# Altium schematic sheet 1700-0003_PowerBoard_REV-A_0.SchDoc: 1700-0003_PowerBoard_REV-A
size 897 x 577 mm; DRAWING_DATE: 4/15/2022; DRAWING_TITLE: PQI380 UNIV. INTERFACE BRD; PART_NUMBER: 7000-0303; REV: R12; Origin: Eagle; DWG-CO-NAME: DWG-CO-NAME; DWG-DATE: DWG-DATE; DWG-NUMBER: DWG-NUMBER; DWG-REV: DWG-REV; DWG-TITLE: DWG-TITLE; SIZE: SIZE; Date: 7/10/2024 1:57:37 PM; SheetNumber: 1; GateName_1: G$1; SymbolName_1: FRAME_D_L; LibraryName: frames; DeviceSetName: FRAME_D_L; GateName_2: G$2; SymbolName_2: DOCFIELD; Sheet: Sheet:
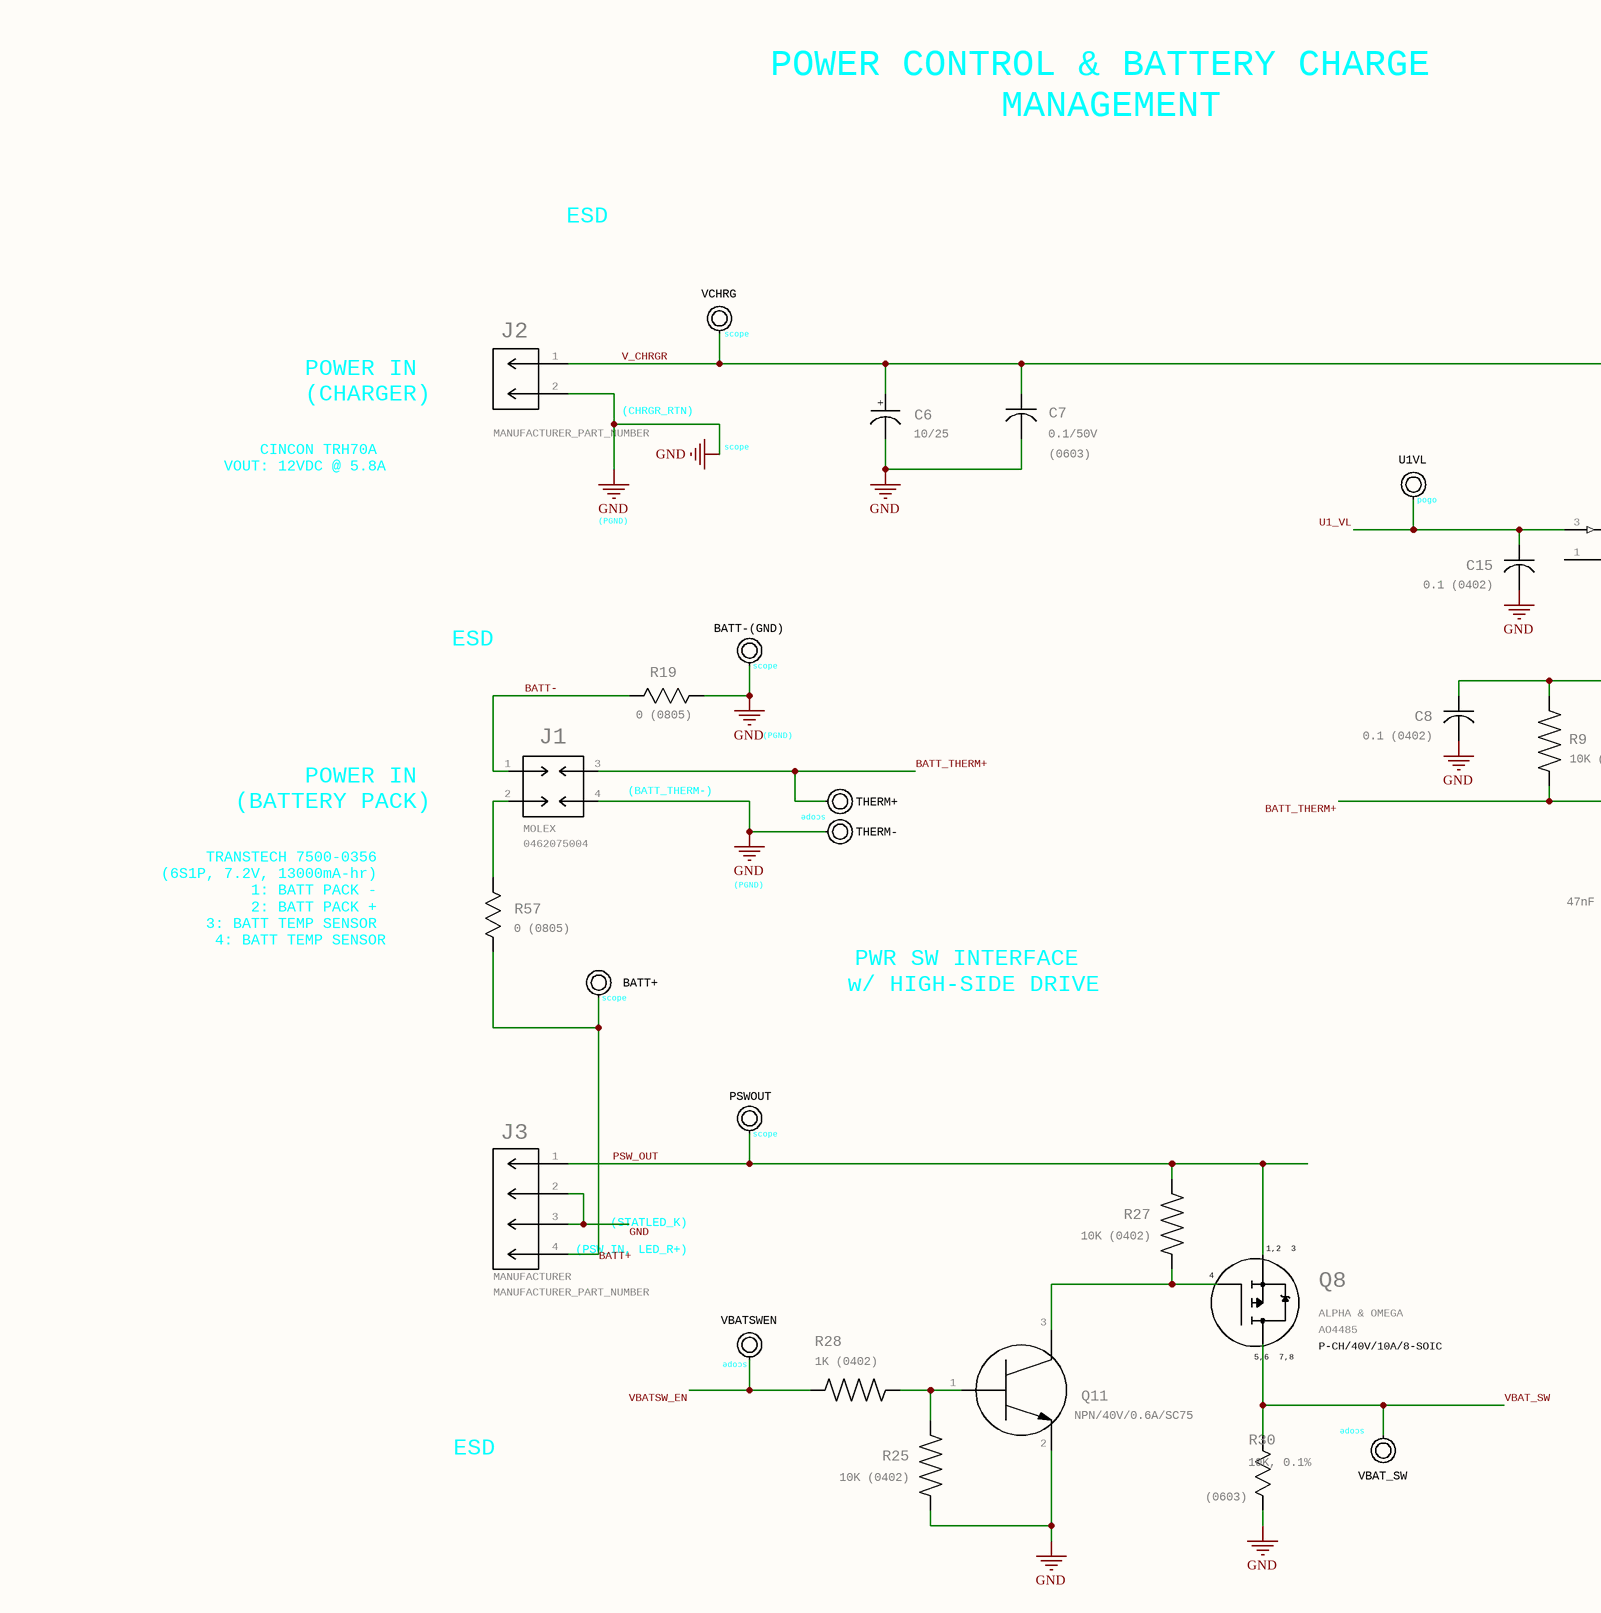
[diagram p0: 1700-0003_PowerBoard_REV-A_0.SchDoc, top left]
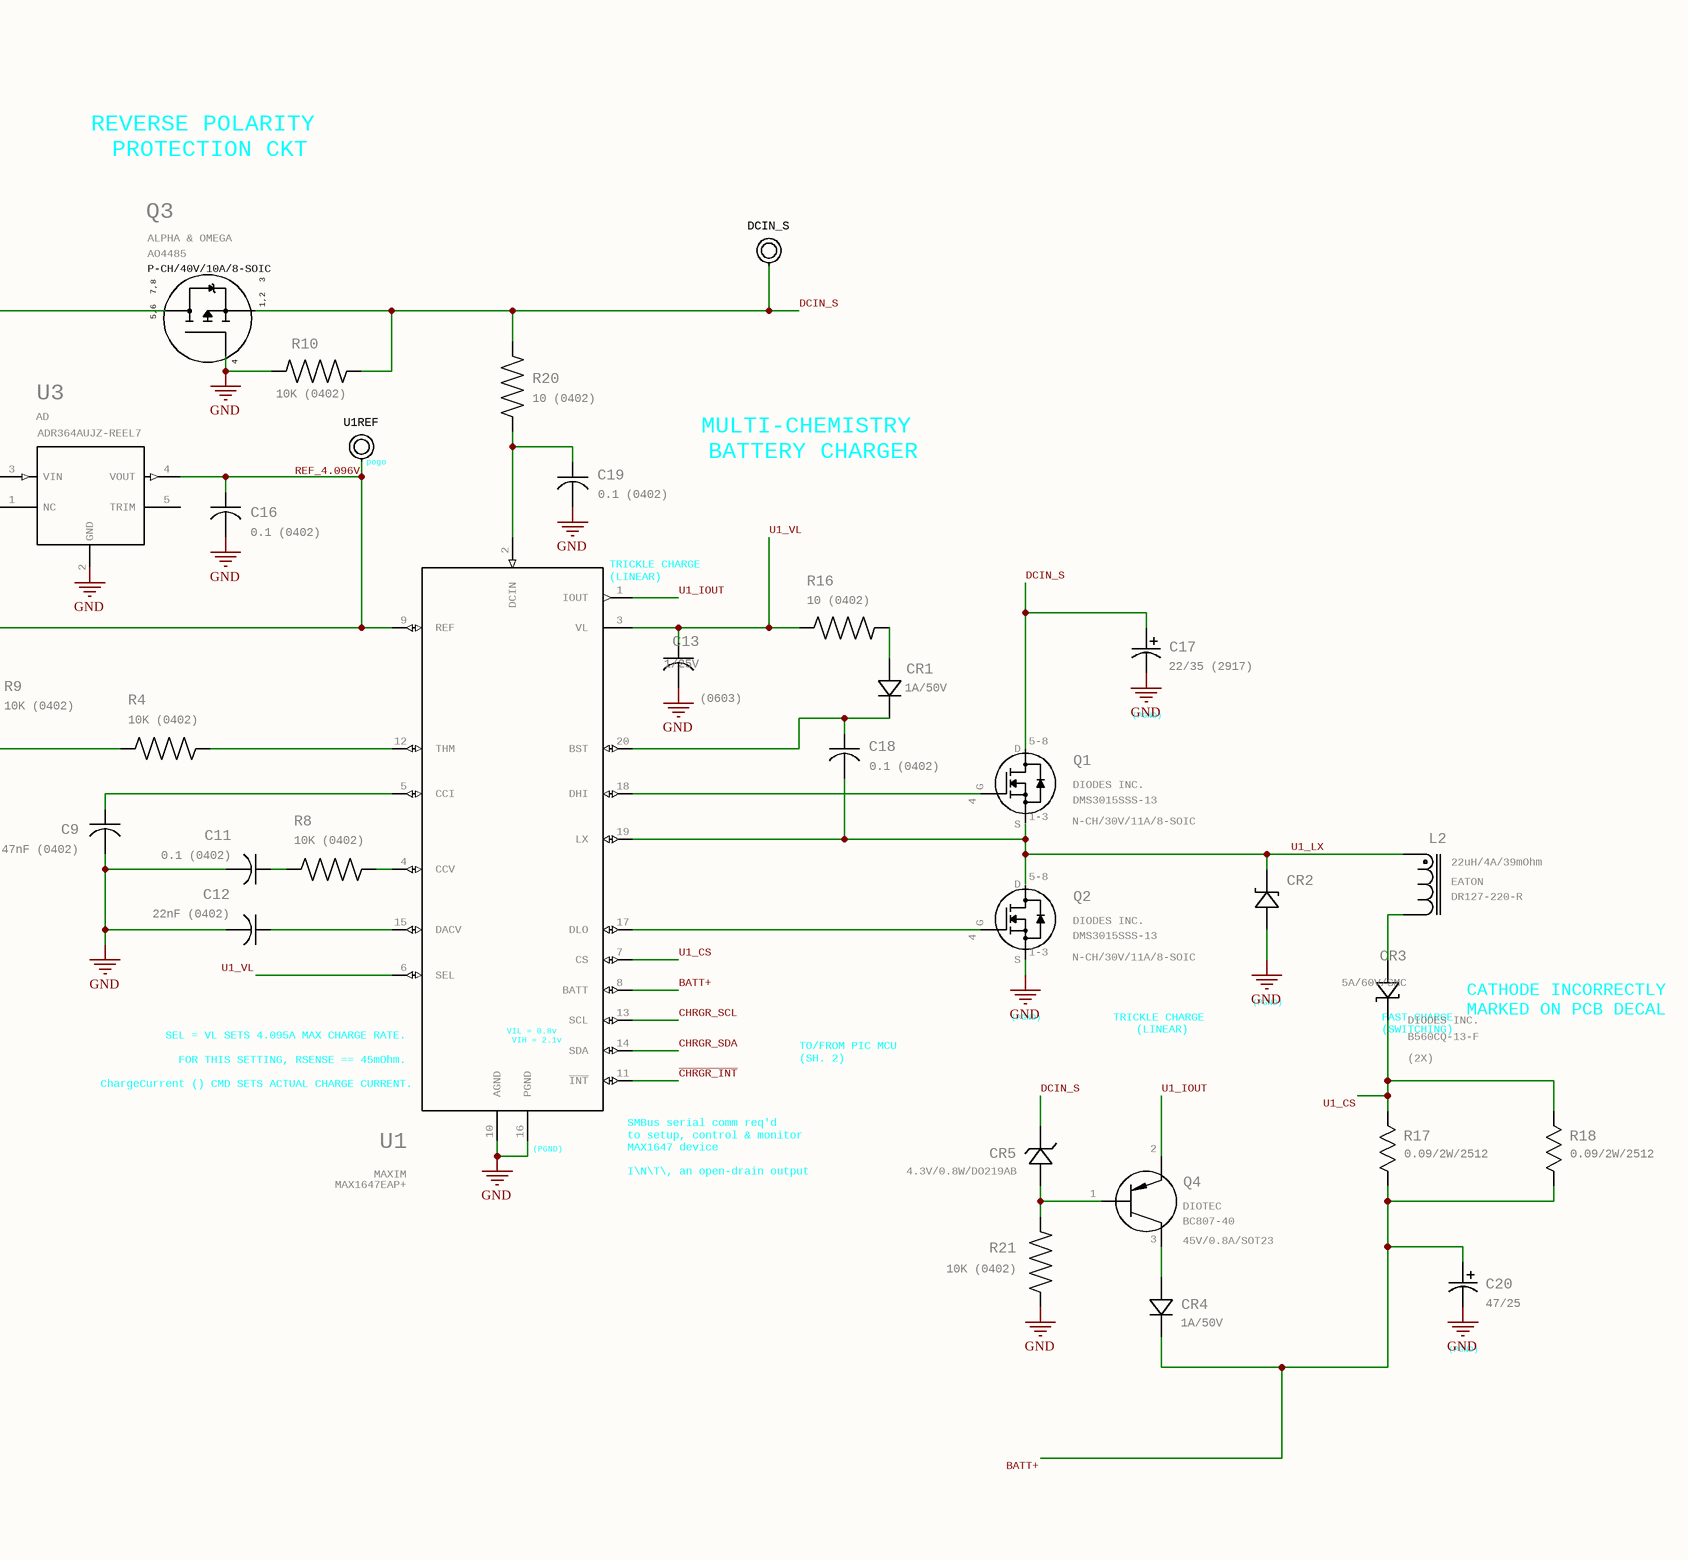
[diagram p1: 1700-0003_PowerBoard_REV-A_0.SchDoc, top middle]
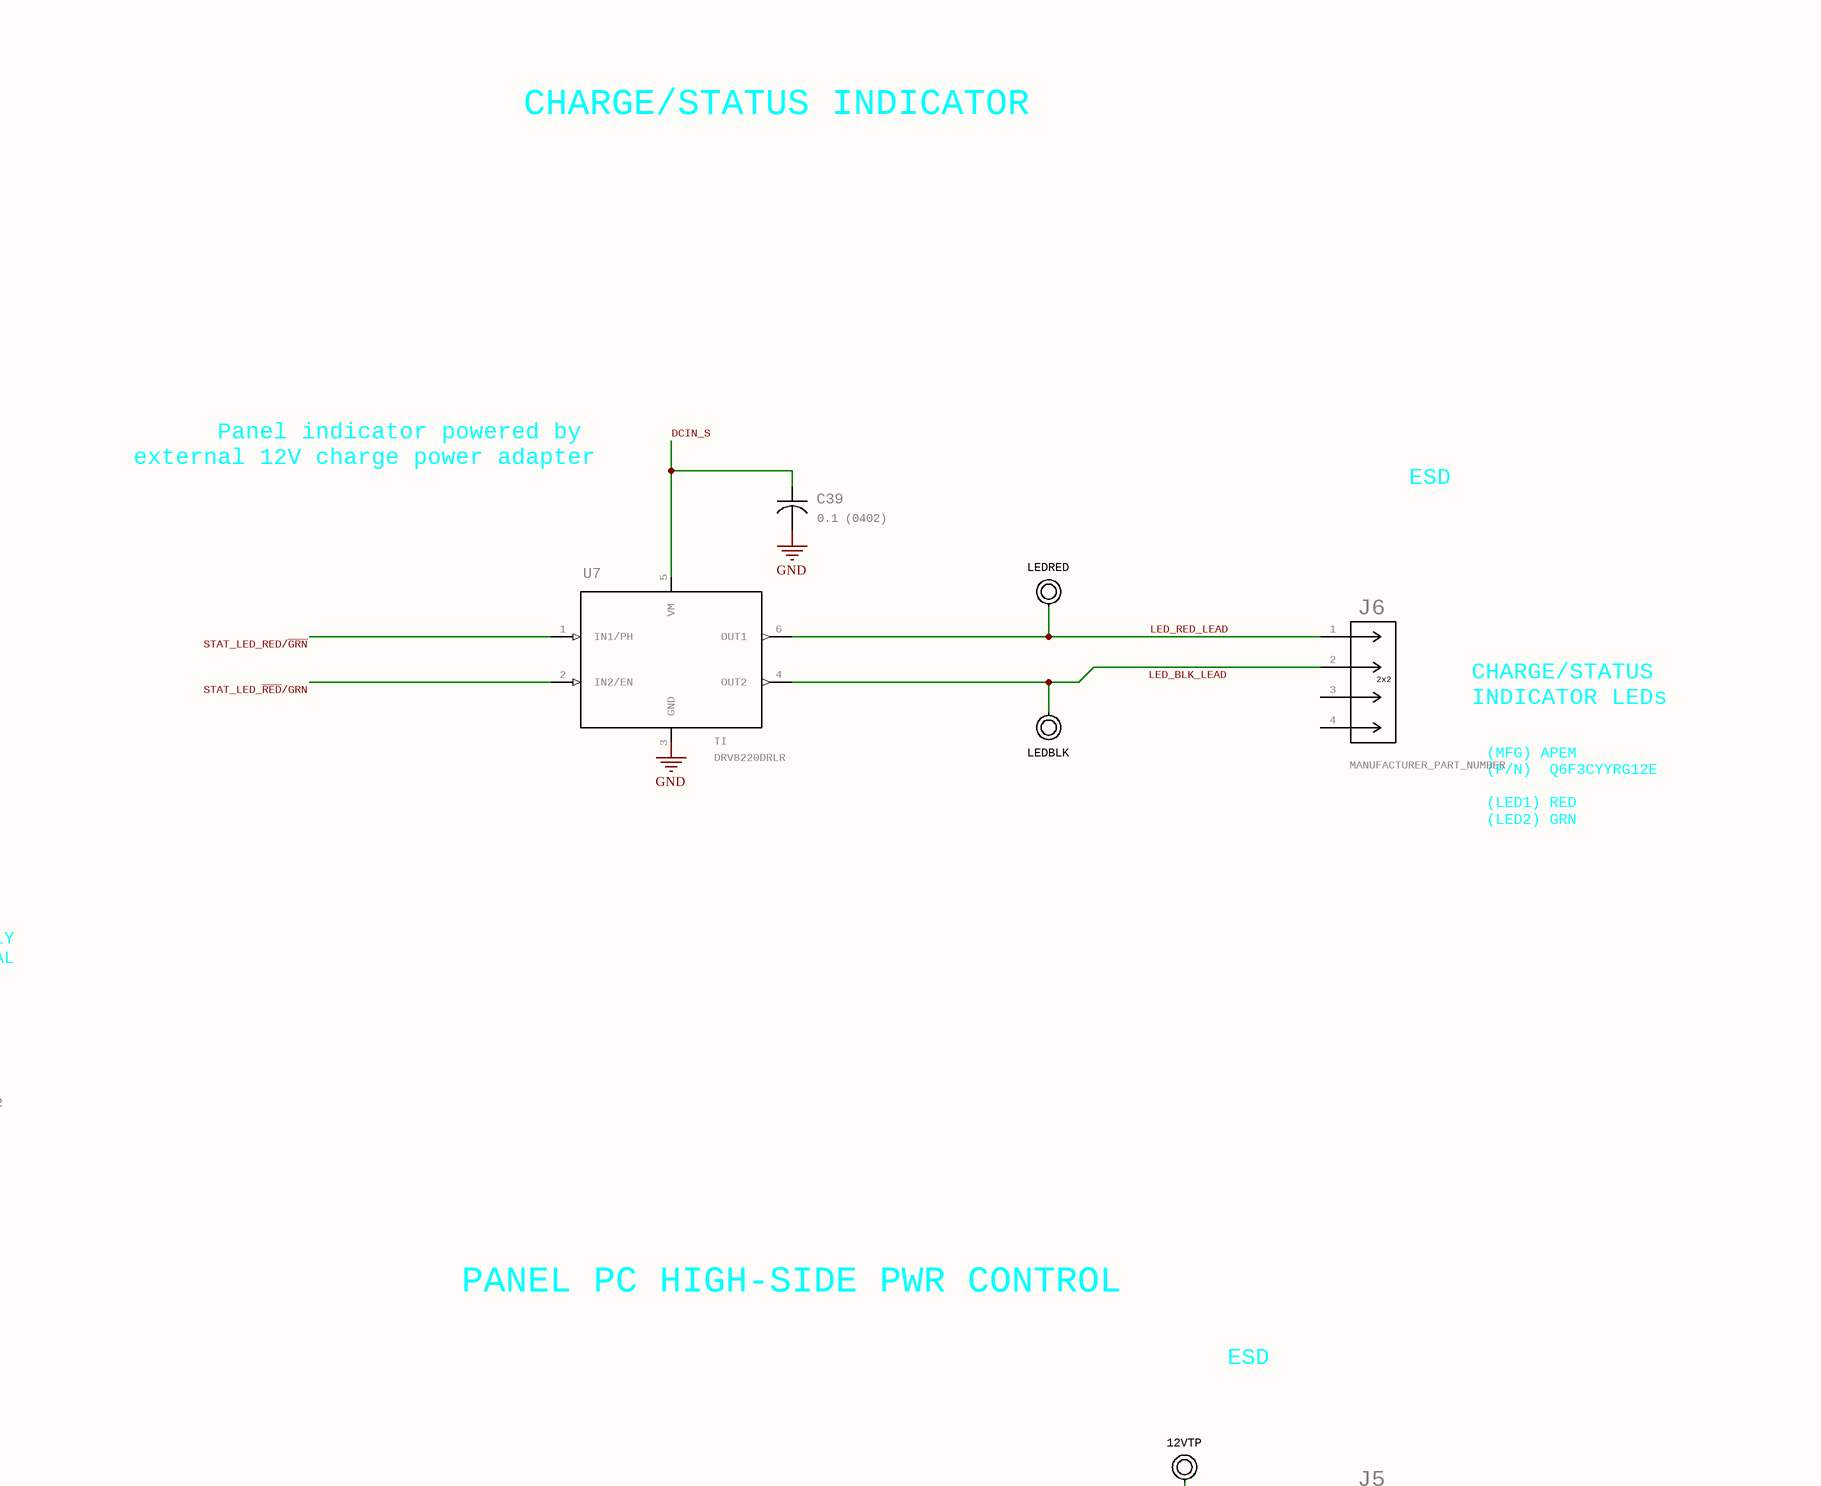
[diagram p2: 1700-0003_PowerBoard_REV-A_0.SchDoc, top right]
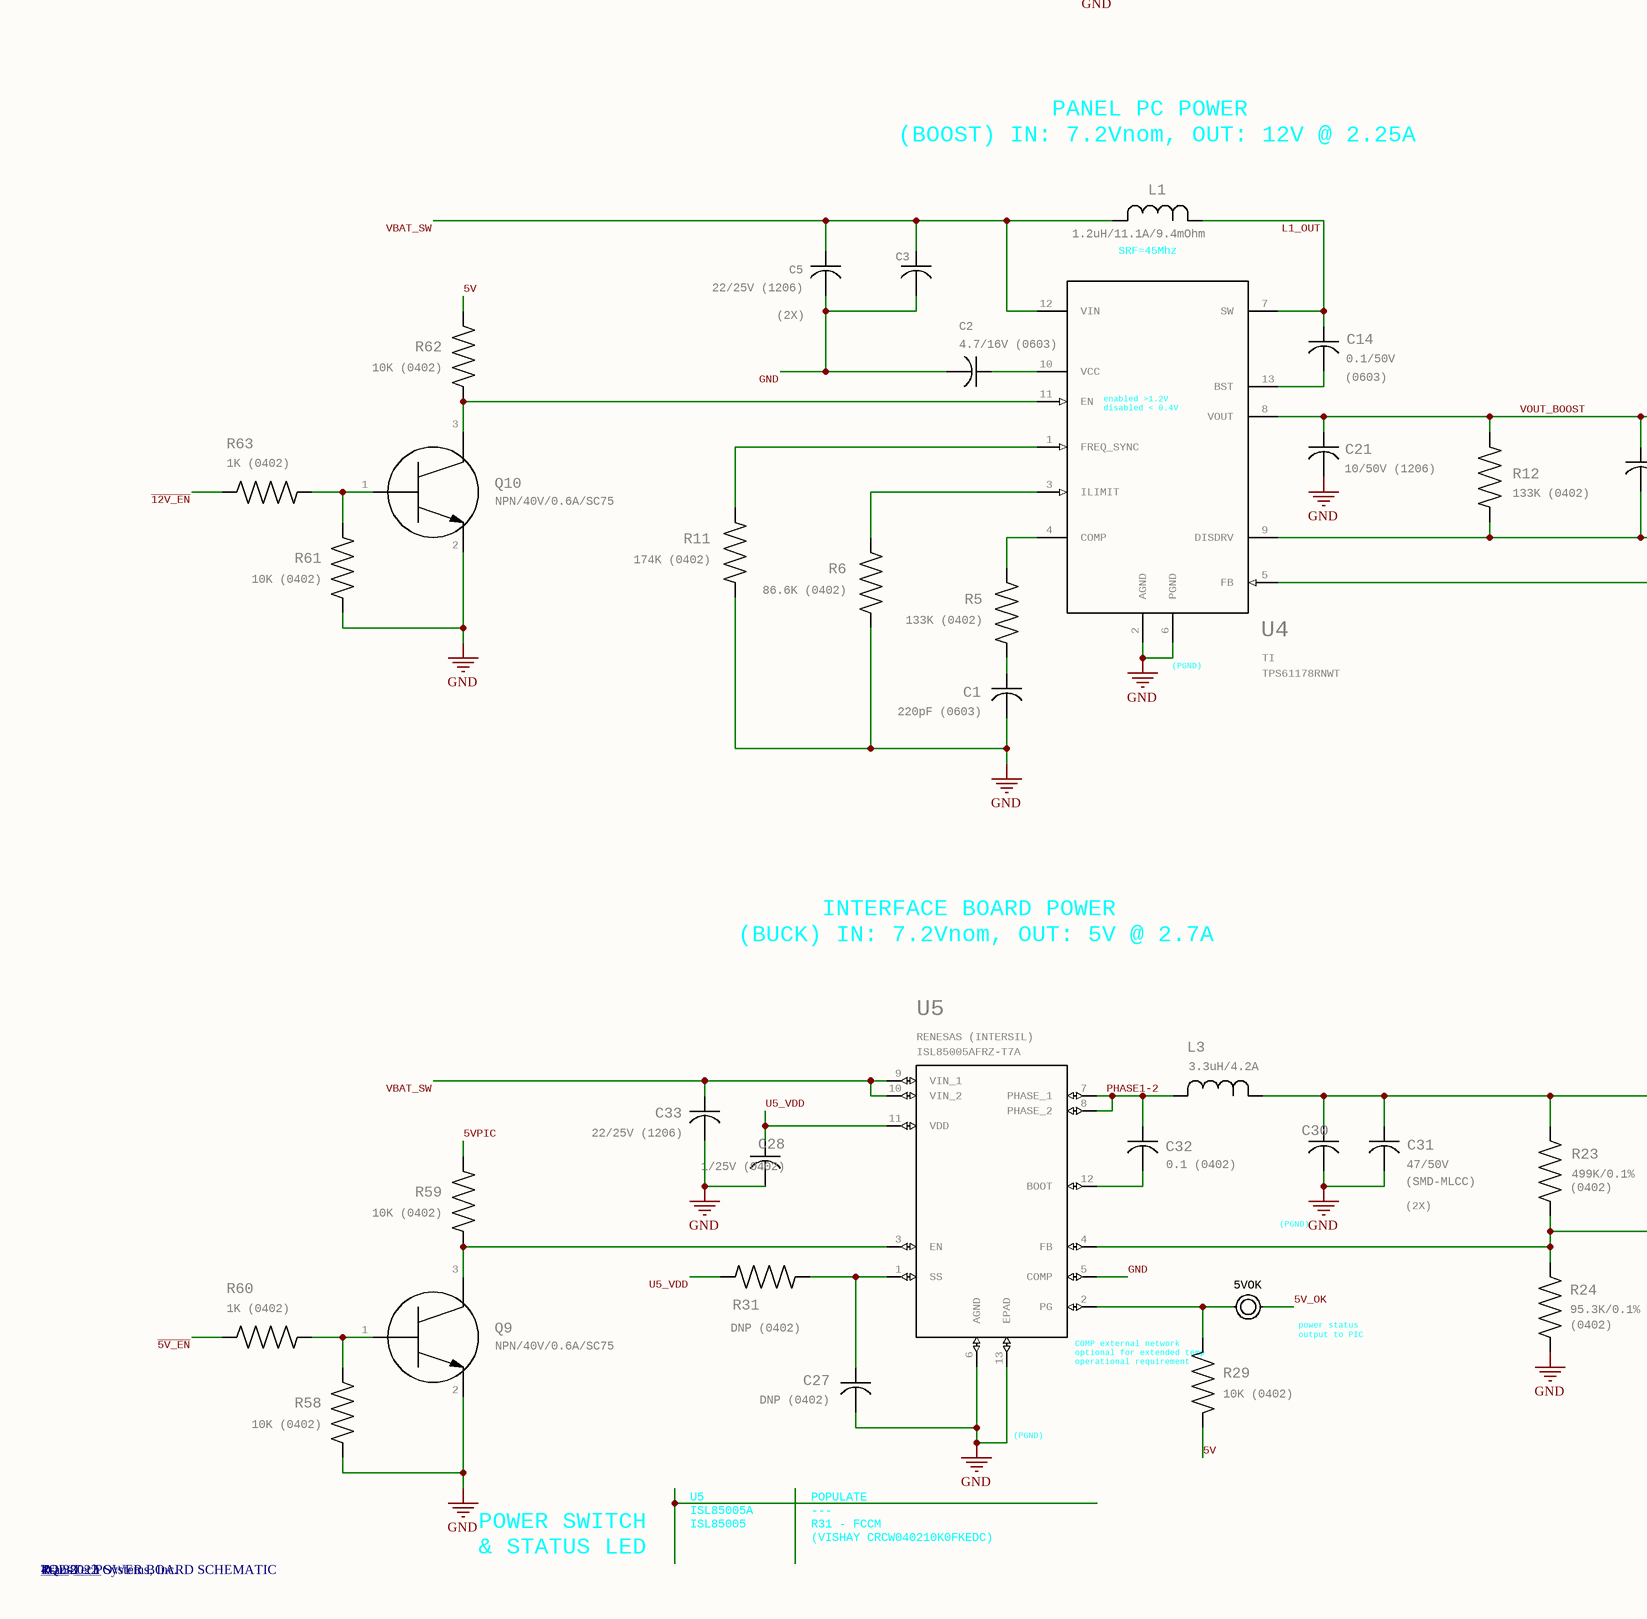
[diagram p3: 1700-0003_PowerBoard_REV-A_0.SchDoc, bottom left]
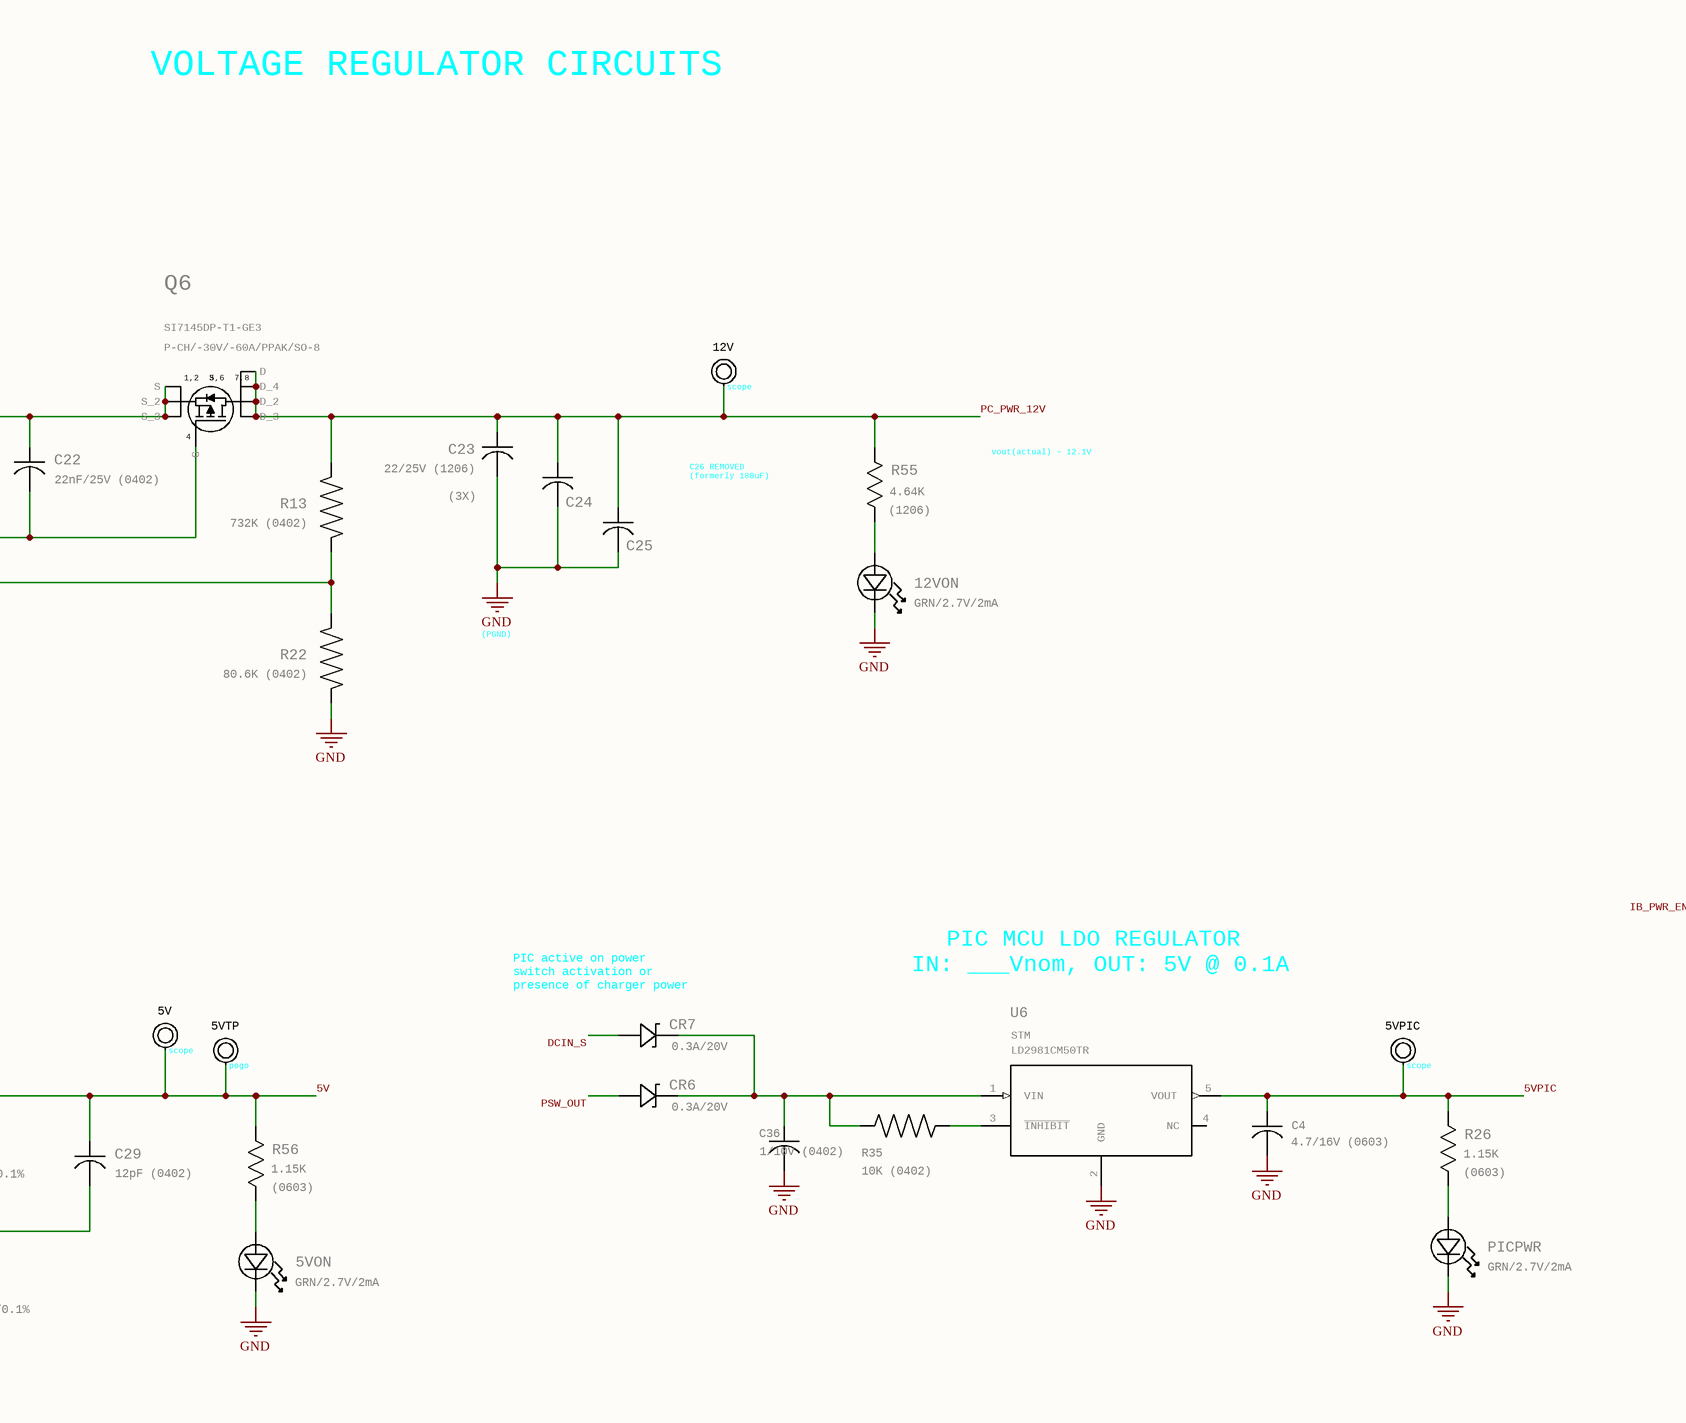
[diagram p4: 1700-0003_PowerBoard_REV-A_0.SchDoc, bottom middle]
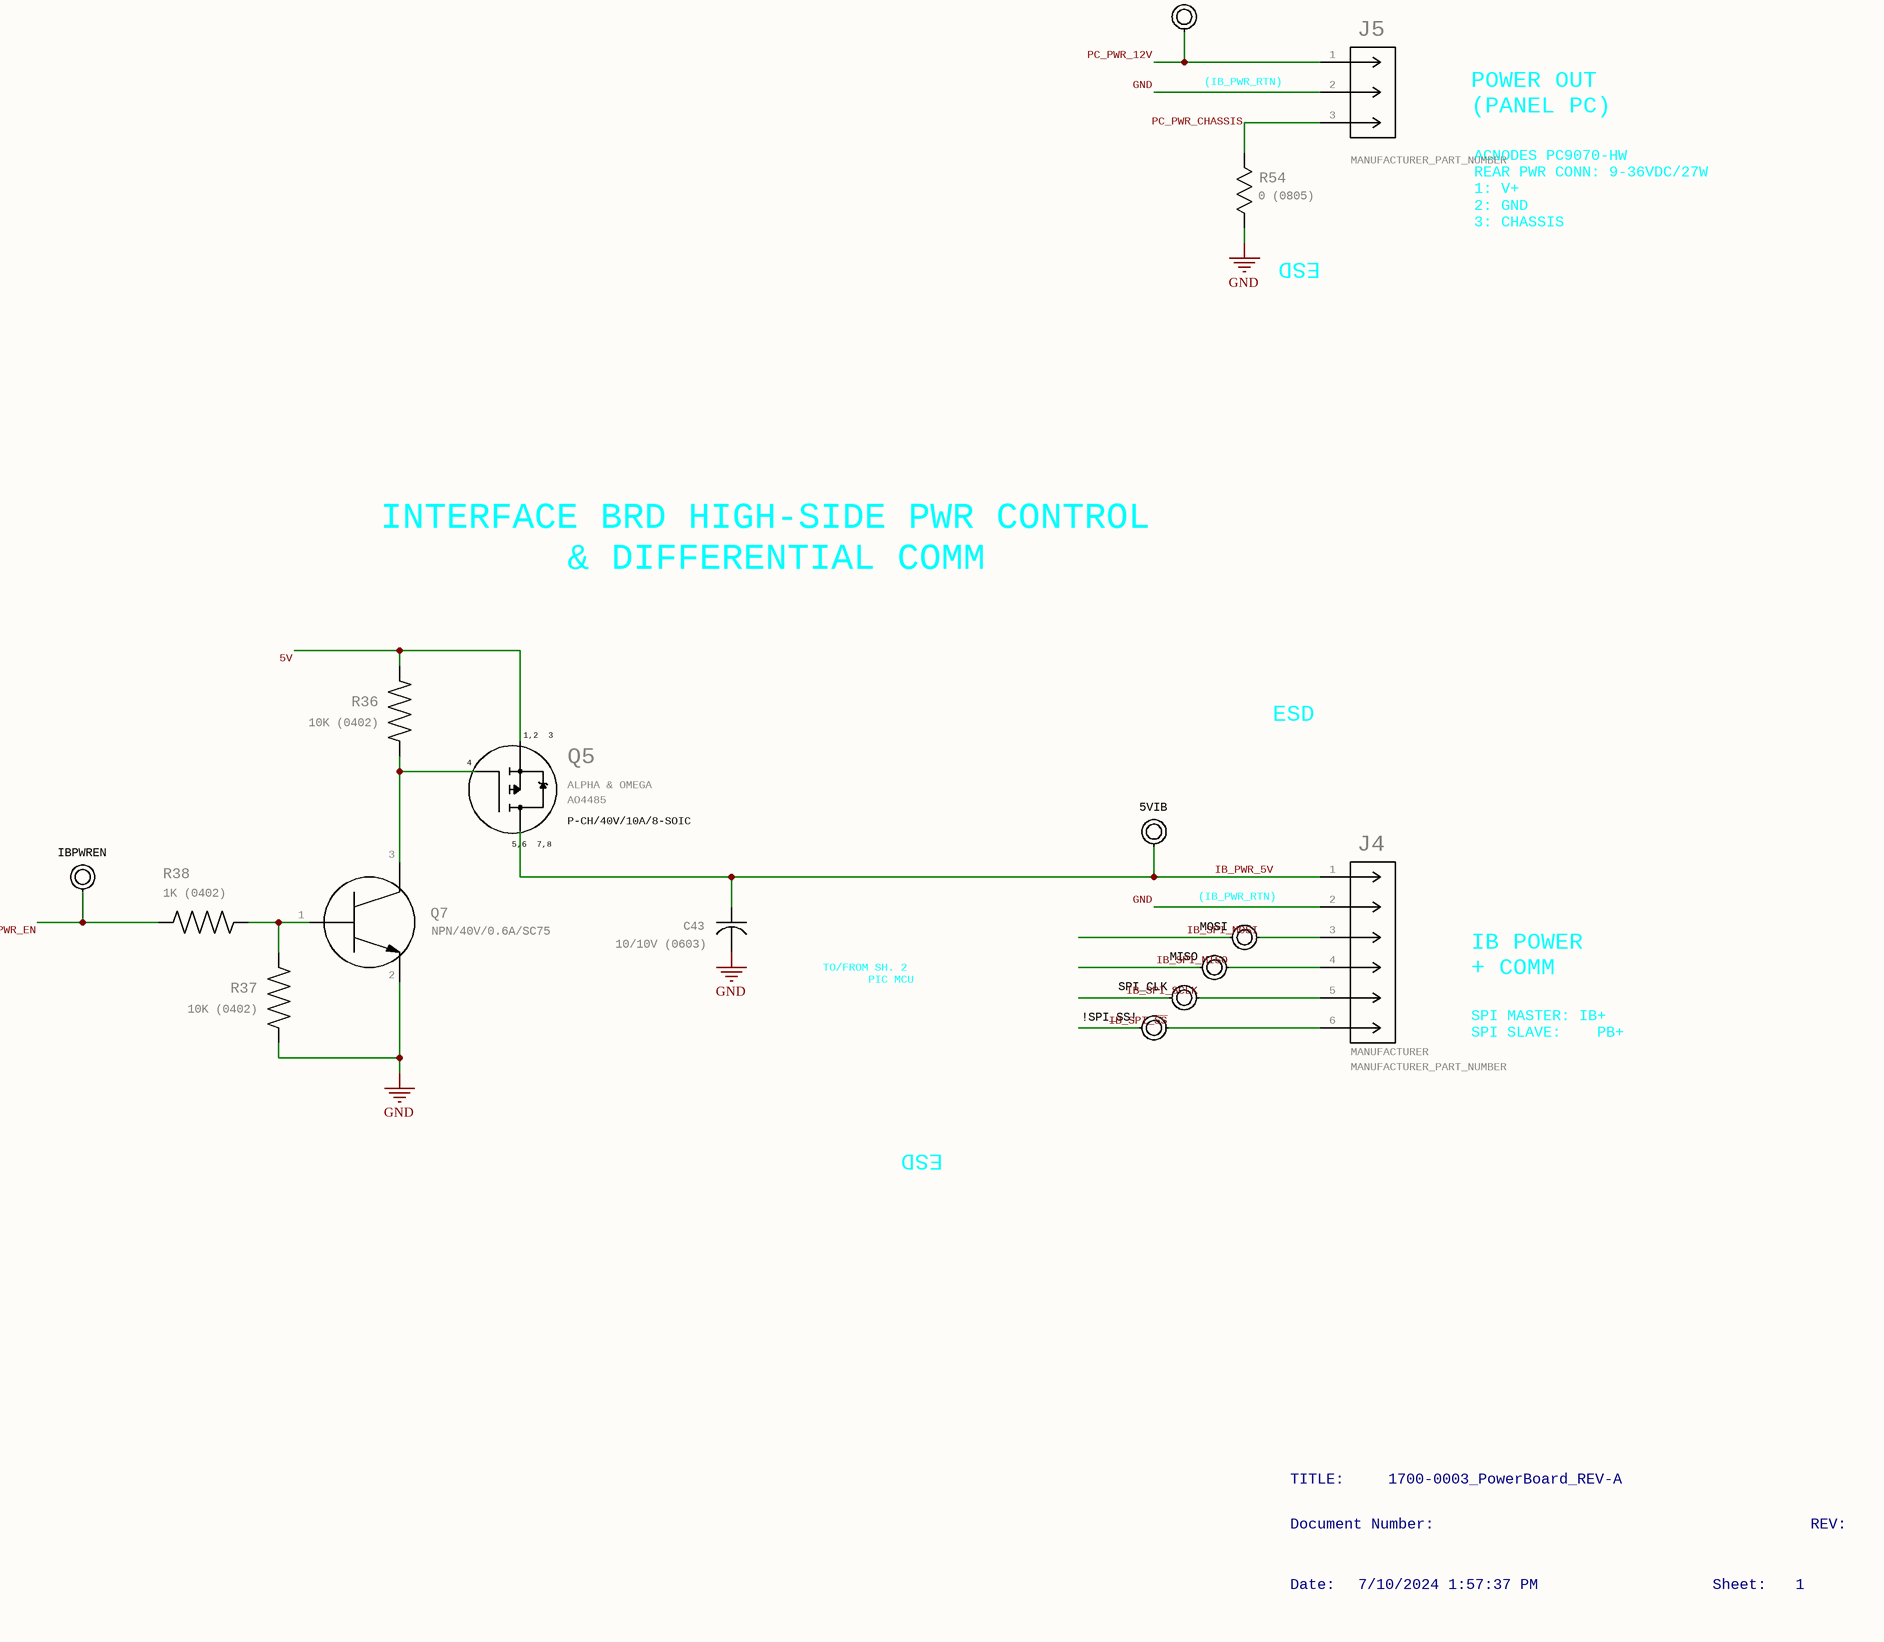
[diagram p5: 1700-0003_PowerBoard_REV-A_0.SchDoc, bottom right]

## Parts
5V  TST_POINT_PTH_042-OCT  [TST_POINT_PTH_042-OCT]  (value not drawn)
5VIB  TST_POINT_PTH_20X40MIL  [TST_POINT_PTH_20X40MIL]  (value not drawn)
5VOK  TST_POINT_PTH_20X40MIL_2PIN  [TST_POINT_PTH_20X40MIL_2PIN]  (value not drawn)
5VON  GRN/2.7V/2mA  [LED_DIALIGHT_598_DIA]
5VPIC  TST_POINT_PTH_042-OCT  [TST_POINT_PTH_042-OCT]  (value not drawn)
5VTP  TST_POINT_PTH_20X40MIL  [TST_POINT_PTH_20X40MIL]  (value not drawn)
12V  TST_POINT_PTH_042-OCT  [TST_POINT_PTH_042-OCT]  (value not drawn)
12VON  GRN/2.7V/2mA  [LED_DIALIGHT_598_DIA]
12VTP  TST_POINT_PTH_20X40MIL  [TST_POINT_PTH_20X40MIL]  (value not drawn)
!SPI_SS!  TST_POINT_PTH_042_2PIN  [TST_POINT_PTH_042-OCT_2PIN]  (value not drawn)
BATT+  TST_POINT_PTH_042-OCT  [TST_POINT_PTH_042-OCT]  (value not drawn)
BATT-(GND)  TST_POINT_PTH_042-OCT  [TST_POINT_PTH_042-OCT]  (value not drawn)
C1  220pF (0603)  [CAP_C1608_TDK]
C2  4.7/16V (0603)  [CAP_C1608_TDK]
C3  22/25V (1206)  [CAP_CL31_SAM]  (value not drawn)
C4  4.7/16V (0603)  [CAP_C1608_TDK]
C5  22/25V (1206)  QTY_AREA: (2X)  [CAP_CL31_SAM]
C6  10/25  [CAP_AFK106M25B12T-F_CND-L]
C7  0.1/50V  PACKAGE: (0603)  [CAP_C1608_TDK]
C8  0.1 (0402)  [G-155_MUR]
C9  47nF (0402)  [G-155_MUR]
C11  0.1 (0402)  [G-155_MUR]
C12  22nF (0402)  [G-155_MUR]
C13  1/25V  PACKAGE: (0603)  [CAP_C1608_TDK]
C14  0.1/50V  PACKAGE: (0603)  [CAP_C1608_TDK]
C15  0.1 (0402)  [G-155_MUR]
C16  0.1 (0402)  [G-155_MUR]
C17  22/35 (2917)  [CAPMP7.6X4.3_3.1N_KEM]
C18  0.1 (0402)  [G-155_MUR]
C19  0.1 (0402)  [G-155_MUR]
C20  47/25  [CAPMP7.6X4.3_3.1N_KEM]
C21  10/50V (1206)  [CAP_CL31_SAM]
C22  22nF/25V (0402)  [G-155_MUR]
C23  22/25V (1206)  QTY_AREA: (3X)  [CAP_CL31_SAM]
C24  22/25V (1206)  [CAP_CL31_SAM]  (value not drawn)
C25  22/25V (1206)  [CAP_CL31_SAM]  (value not drawn)
C27  DNP (0402)  [G-155_MUR]
C28  1/25V (0402)  [G-155_MUR]
C29  12pF (0402)  [G-155_MUR]
C30  47/50V (MLCC-SMD)  [CAP_CKG57N_TDK]  (value not drawn)
C31  47/50V  PACKAGE: (SMD-MLCC)  QTY_AREA: (2X)  [CAP_CKG57N_TDK]
C32  0.1 (0402)  [G-155_MUR]
C33  22/25V (1206)  [CAP_CL31_SAM]
C36  1/10V (0402)  [G-155_MUR]
C39  0.1 (0402)  [G-155_MUR]
C43  10/10V (0603)  [CAP_C1608_TDK]
CR1  1A/50V  [SMA_DIO]
CR2  5A/60V/SMC  [CR_0CQ-13-F_DIO]  (value not drawn)
CR3  5A/60V/SMC  MANUFACTURER: DIODES INC.  MANUFACTURER_PART_NUMBER: B560CQ-13-F  QTY_AREA: (2X)  [CR_0CQ-13-F_DIO]
CR4  1A/50V  [SMA_DIO]
CR5  4.3V/0.8W/DO219AB  [DIO_BZD27C4V3P_VIS]
CR6  0.3A/20V  [USC_TOS]
CR7  0.3A/20V  [USC_TOS]
DCIN_S  TST_POINT_PTH_042-OCT  [TST_POINT_PTH_042-OCT]  (value not drawn)
IBPWREN  TST_POINT_PTH_042-OCT  [TST_POINT_PTH_042-OCT]  (value not drawn)
J1  MANUFACTURER: MOLEX  MANUFACTURER_PART_NUMBER: 0462075004  [MOLEX_462075004]  (hidden comment: MOLEX_MINI-FIT-JR_462075004)
J2  MOLEX_NANO-FIT_1053111302  [CON_1053111302_MOL]  (value not drawn)
J3  MOLEX_NANO-FIT_1053111304  [CON_1053111304_MOL]  (value not drawn)
J4  MOLEX_1053111206  [CON_1053111206_MOL]  (value not drawn)
J5  MOLEX_NANO-FIT_1053111303  [CON_1053111303_MOL]  (value not drawn)
J6  CON_MOLEX_NANOFIT_1053121304  [CON_1053121304]  (value not drawn)
L1  1.2uH/11.1A/9.4mOhm  [IND_XAL50XX_COC]
L2  22uH/4A/39mOhm  MANUFACTURER: EATON  MANUFACTURER_PART_NUMBER: DR127-220-R  [DR127]
L3  3.3uH/4.2A  [IND_CB_DRA74]
LEDBLK  TST_POINT_PTH_20X40MIL  [TST_POINT_PTH_20X40MIL]  (value not drawn)
LEDRED  TST_POINT_PTH_20X40MIL  [TST_POINT_PTH_20X40MIL]  (value not drawn)
MISO  TST_POINT_PTH_042_2PIN  [TST_POINT_PTH_042-OCT_2PIN]  (value not drawn)
MOSI  TST_POINT_PTH_042_2PIN  [TST_POINT_PTH_042-OCT_2PIN]  (value not drawn)
PICPWR  GRN/2.7V/2mA  [LED_DIALIGHT_598_DIA]
PSWOUT  TST_POINT_PTH_042-OCT  [TST_POINT_PTH_042-OCT]  (value not drawn)
Q1  N-CH/30V/11A/8-SOIC  MANUFACTURER: DIODES INC.  MANUFACTURER_PART_NUMBER: DMS3015SSS-13  [SOIC127P600X175-8N]
Q2  N-CH/30V/11A/8-SOIC  MANUFACTURER: DIODES INC.  MANUFACTURER_PART_NUMBER: DMS3015SSS-13  [SOIC127P600X175-8N]
Q3  P-CH/40V/10A/8-SOIC  5,6
7,8: 5,6 / 7,8  1,2
3: 1,2 / 3  MANUFACTURER: ALPHA & OMEGA  MANUFACTURER_PART_NUMBER: AO4485  [SOIC127P600X175-8N]
Q4  45V/0.8A/SOT23  MANUFACTURER: DIOTEC  MANUFACTURER_PART_NUMBER: BC807-40  [SOT-23-3_DIOTEC]
Q5  P-CH/40V/10A/8-SOIC  5,6
7,8: 5,6 / 7,8  1,2
3: 1,2 / 3  MANUFACTURER: ALPHA & OMEGA  MANUFACTURER_PART_NUMBER: AO4485  [SOIC127P600X175-8N]
Q6  P-CH/-30V/-60A/PPAK/SO-8  5,6
7,8: 5,6 / 7,8  1,2
3: 1,2 / 3  MANUFACTURER_PART_NUMBER: SI7145DP-T1-GE3  [SON8_SI7135DP-T1-GE3_VIS]
Q7  NPN/40V/0.6A/SC75  [SC-75(SOT-416)_ONSEMI]
Q8  P-CH/40V/10A/8-SOIC  5,6
7,8: 5,6 / 7,8  1,2
3: 1,2 / 3  MANUFACTURER: ALPHA & OMEGA  MANUFACTURER_PART_NUMBER: AO4485  [SOIC127P600X175-8N]
Q9  NPN/40V/0.6A/SC75  [SC-75(SOT-416)_ONSEMI]
Q10  NPN/40V/0.6A/SC75  [SC-75(SOT-416)_ONSEMI]
Q11  NPN/40V/0.6A/SC75  [SC-75(SOT-416)_ONSEMI]
R4  10K (0402)  [RESC1005X35N]
R5  133K (0402)  [RESC1005X35N]
R6  86.6K (0402)  [RESC1005X35N]
R8  10K (0402)  [RESC1005X35N]
R9  10K (0402)  [RESC1005X35N]
R10  10K (0402)  [RESC1005X35N]
R11  174K (0402)  [RESC1005X35N]
R12  133K (0402)  [RESC1005X35N]
R13  732K (0402)  [RESC1005X35N]
R16  10 (0402)  [RESC1005X35N]
R17  0.09/2W/2512  [RES_2512_TECONN]
R18  0.09/2W/2512  [RES_2512_TECONN]
R19  0 (0805)  [STA_HCJ0805_STP]
R20  10 (0402)  [RESC1005X35N]
R21  10K (0402)  [RESC1005X35N]
R22  80.6K (0402)  [RESC1005X35N]
R23  499K/0.1%  PACKAGE: (0402)  [RESC1005X35N]
R24  95.3K/0.1%  PACKAGE: (0402)  [RESC1005X35N]
R25  10K (0402)  [RESC1005X35N]
R26  1.15K  PACKAGE: (0603)  [STA_RMCF0603_STP]
R27  10K (0402)  [RESC1005X35N]
R28  1K (0402)  [RESC1005X35N]
R29  10K (0402)  [RESC1005X35N]
R30  10K, 0.1%  PACKAGE: (0603)  [STA_RMCF0603_STP]
R31  DNP (0402)  [RESC1005X35N]
R35  10K (0402)  [RESC1005X35N]
R36  10K (0402)  [RESC1005X35N]
R37  10K (0402)  [RESC1005X35N]
R38  1K (0402)  [RESC1005X35N]
R54  0 (0805)  [STA_HCJ0805_STP]
R55  4.64K  PACKAGE: (1206)  [RC1206N_YAG]
R56  1.15K  PACKAGE: (0603)  [STA_RMCF0603_STP]
R57  0 (0805)  [STA_HCJ0805_STP]
R58  10K (0402)  [RESC1005X35N]
R59  10K (0402)  [RESC1005X35N]
R60  1K (0402)  [RESC1005X35N]
R61  10K (0402)  [RESC1005X35N]
R62  10K (0402)  [RESC1005X35N]
R63  1K (0402)  [RESC1005X35N]
SPI_CLK  TST_POINT_PTH_042_2PIN  [TST_POINT_PTH_042-OCT_2PIN]  (value not drawn)
THERM+  TST_POINT_PTH_042-OCT  [TST_POINT_PTH_042-OCT]  (value not drawn)
THERM-  TST_POINT_PTH_042-OCT  [TST_POINT_PTH_042-OCT]  (value not drawn)
U1  MANUFACTURER: MAXIM  [21-0056C_20_MXM]  (hidden comment: MAX1647EAP+)
U1REF  TST_POINT_PTH_20X40MIL  [TST_POINT_PTH_20X40MIL]  (value not drawn)
U1VL  TST_POINT_PTH_20X40MIL  [TST_POINT_PTH_20X40MIL]  (value not drawn)
U3  MANUFACTURER: AD  MANUFACTURER_PART_NUMBER: ADR364AUJZ-REEL7  [UJ_5_ADI]  (hidden comment: AD_REFERENCE_ADR364AUJZ-REEL7)
U4  MANUFACTURER: TI  MANUFACTURER_PART_NUMBER: TPS61178RNWT  [RNW0013A]  (hidden comment: REGULATOR_BOOST_TI_TPS61178RNWT)
U5  MANUFACTURER: RENESAS (INTERSIL)  MANUFACTURER_PART_NUMBER: ISL85005AFRZ-T7A  [SON50P300X400X90-13N]  (hidden comment: REGULATOR_BUCK_RENESAS_ISL85005AFRZ-T7A)
U6  MANUFACTURER: STM  MANUFACTURER_PART_NUMBER: LD2981CM50TR  [SOT23-5L_STM]  (hidden comment: IC_LDO_STM_LD2981CM50TR)
U7  MANUFACTURER: TI  MANUFACTURER_PART_NUMBER: DRV8220DRLR  [SOT5X3-6_DRL_TEX]  (hidden comment: IC_H-BRIDGE_TI_DRV8220DRLR)
VBAT_SW  TST_POINT_PTH_042-OCT  [TST_POINT_PTH_042-OCT]  (value not drawn)
VBATSWEN  TST_POINT_PTH_042-OCT  [TST_POINT_PTH_042-OCT]  (value not drawn)
VCHRG  TST_POINT_PTH_042-OCT  [TST_POINT_PTH_042-OCT]  (value not drawn)

## Nets
GND: 5VON.1 12VON.1 BATT-(GND).P$1 C1.2 C2.2 C3.2 C4.2 C5.2 C6.2 C7.2 C8.2 C9.2 C11.2 C12.2 C13.2 C15.2 C16.2 C17.2 C19.2 C20.2 C21.2 C23.2 C24.2 C25.2 C27.2 C28.2 C30.2 C31.2 C33.2 C36.2 C39.2 C43.2 CR2.1(A) J1.4 J2.2 J3.2 J3.3 J4.2 J5.2 PICPWR.1 Q2.1-3(S) Q3.4(G) Q7.2(E) Q9.2(E) Q10.2(E) Q11.2(E) R6.2 R10.1 R11.2 R19.1 R21.2 R22.2 R24.2 R25.1 R30.2 R37.1 R54.2 R58.1 R61.1 THERM-.P$1 U1.10(AGND) U1.16(PGND) U3.2(GND) U4.2(AGND) U4.6(PGND) U5.5(COMP) U5.6(AGND) U5.13(EPAD) U6.2(GND) U7.3(GND)
~{12V_EN}: R63.1
~{5V_EN}: R60.1
5V: 5V.P$1 5VTP.P$1 C29.1 C30.1 C31.1 L3.1 Q5.1-3(S) R23.1 R29.1 R36.2 R56.2 R62.2
5V_OK: 5VOK.P$1
5VPIC: 5VPIC.P$1 C4.1 R26.2 R59.2 U6.5(VOUT)
BATT+: BATT+.P$1 C20.1 CR4.1 J3.4 R17.2 R18.2 R57.1 U1.8(BATT)
BATT-: J1.1 R19.2
BATT_THERM+: J1.3 R4.1 R9.2 THERM+.P$1
~{CHRGR_INT}: U1.11(~{INT})
CHRGR_SCL: U1.13(SCL)
CHRGR_SDA: U1.14(SDA)
DCIN_S: C17.1 C39.1 CR5.2(K) CR7.2(A) DCIN_S.P$1 Q1.5-8(D) Q3.1-3(S) R10.2 R20.2 U7.5(VM)
IB_PWR_5V: 5VIB.P$1 C43.1 J4.1 Q5.5-8(D)
IB_PWR_EN: IBPWREN.P$1 R38.1
IB_SPI_MISO: J4.4 MISO.P$1
IB_SPI_MOSI: J4.3 MOSI.P$1
IB_SPI_~{SS}: !SPI_SS!.P$1 J4.6
IB_SPI_SCLK: J4.5 SPI_CLK.P$1
L1_OUT: C14.1 L1.1 U4.7(SW)
LED_BLK_LEAD: J6.2 LEDBLK.P$1 U7.4(OUT2)
LED_RED_LEAD: J6.1 LEDRED.P$1 U7.6(OUT1)
PC_PWR_12V: 12V.P$1 12VTP.P$1 C23.1 C24.1 C25.1 J5.1 Q6.5(D_3) Q6.6(D_2) Q6.7(D_4) Q6.8(D) R13.1 R55.1
PC_PWR_CHASSIS: J5.3 R54.1
PHASE1-2: C32.1 L3.2 U5.7(PHASE_1) U5.8(PHASE_2)
PSW_OUT: CR6.2(A) J3.1 PSWOUT.P$1 Q8.1-3(S) R27.2
REF_4.096V: C8.1 C16.1 R9.1 U1.9(REF) U1REF.P$1 U3.4(VOUT)
STAT_LED_~{RED}/GRN: U7.2(IN2/EN)
STAT_LED_RED/~{GRN}: U7.1(IN1/PH)
U1_CS: CR3.2(K) R17.1 R18.1 U1.7(CS)
U1_IOUT: Q4.2(E) U1.1(IOUT)
U1_LX: C18.2 CR2.2(K) L2.1 Q1.1-3(S) Q2.5-8(D) U1.19(LX)
U1_VL: C13.1 C15.1 R16.1 U1.3(VL) U1.6(SEL) U1VL.P$1 U3.3(VIN)
U5_VDD: C28.1 R31.1 U5.11(VDD)
V_CHRGR: C6.1 C7.1 J2.1 Q3.5-8(D) VCHRG.P$1
VBAT_SW: C3.1 C5.1 C33.1 L1.2 Q8.5-8(D) R30.1 U4.12(VIN) U5.9(VIN_1) U5.10(VIN_2) VBAT_SW.P$1
VBATSW_EN: R28.1 VBATSWEN.P$1
VOUT_BOOST: C21.1 C22.1 Q6.1(S_3) Q6.2(S_2) Q6.3(S) R12.1 U4.8(VOUT)
Net5VOK_P$2: 5VOK.P$2 R29.2 U5.2(PG)
Net5VON_2: 5VON.2 R56.1
Net12VON_2: 12VON.2 R55.2
NetC1_1: C1.1 R5.2
NetC2_1: C2.1 U4.10(VCC)
NetC9_1: C9.1 U1.5(CCI)
NetC11_1: C11.1 R8.1
NetC12_1: C12.1 U1.15(DACV)
NetC14_2: C14.2 U4.13(BST)
NetC18_1: C18.1 CR1.1 U1.20(BST)
NetC19_1: C19.1 R20.1 U1.2(DCIN)
NetC22_2: C22.2 Q6.4(G) R12.2 U4.9(DISDRV)
NetC27_1: C27.1 R31.2 U5.1(SS)
NetC29_2: C29.2 R23.2 R24.1 U5.4(FB)
NetC32_2: C32.2 U5.12(BOOT)
NetC36_1: C36.1 CR6.1(K) CR7.1(K) R35.2 U6.1(VIN)
NetCR1_2: CR1.2 R16.2
NetCR3_1: CR3.1(A) L2.2
NetCR4_2: CR4.2 Q4.3(C)
NetCR5_1: CR5.1(A) Q4.1(B) R21.1
NetJ1_2: J1.2 R57.2
NetPICPWR_2: PICPWR.2 R26.1
NetQ1_4: Q1.4(G) U1.18(DHI)
NetQ2_4: Q2.4(G) U1.17(DLO)
NetQ5_4: Q5.4(G) Q7.3(C) R36.1
NetQ7_1: Q7.1(B) R37.2 R38.2
NetQ8_4: Q8.4(G) Q11.3(C) R27.1
NetQ9_1: Q9.1(B) R58.2 R60.2
NetQ9_3: Q9.3(C) R59.1 U5.3(EN)
NetQ10_1: Q10.1(B) R61.2 R63.2
NetQ10_3: Q10.3(C) R62.1 U4.11(EN)
NetQ11_1: Q11.1(B) R25.2 R28.2
NetR4_2: R4.2 U1.12(THM)
NetR5_1: R5.1 U4.4(COMP)
NetR6_1: R6.1 U4.3(ILIMIT)
NetR8_2: R8.2 U1.4(CCV)
NetR11_1: R11.1 U4.1(FREQ_SYNC)
NetR13_2: R13.2 R22.1 U4.5(FB)
NetR35_1: R35.1 U6.3(~{INHIBIT})

Not connected (* = marked no-connect by the designer): !SPI_SS! P$2; J6 3 4; MISO P$2; MOSI P$2; SPI_CLK P$2; U3 1(NC) 5(TRIM); U6 4(NC)

## Notes on the sheet
- POWER CONTROL & BATTERY CHARGE
  MANAGEMENT
- ESD
- REVERSE POLARITY
  PROTECTION CKT
- CHARGE/STATUS INDICATOR
- (near VCHRG) scope
- POWER IN
  (CHARGER)
- (CHRGR_RTN)
- scope
- CINCON TRH70A
  VOUT: 12VDC @ 5.8A
- (PGND)
- (near U1VL) pogo
- (near U1REF) pogo
- MULTI-CHEMISTRY
  BATTERY CHARGER
- Panel indicator powered by
  external 12V charge power adapter
- (near BATT-(GND)) scope
- (near U1) TRICKLE CHARGE
  (LINEAR)
- POWER IN
  (BATTERY PACK)
- (near J1) (BATT_THERM-)
- (near C17) (PGND)
- CHARGE/STATUS
  INDICATOR LEDs
- TRANSTECH 7500-0356
  (6S1P, 7.2V, 13000mA-hr)
  1: BATT PACK -
  2: BATT PACK +
  3: BATT TEMP SENSOR
  4: BATT TEMP SENSOR
- (MFG) APEM
  (P/N)  Q6F3CYYRG12E
  (LED1) RED
  (LED2) GRN
- (near BATT+) scope
- PWR SW INTERFACE
  w/ HIGH-SIDE DRIVE
- (near U1) VIL = 0.8v
  VIH = 2.1v
- TO/FROM PIC MCU
  (SH. 2)
- (near Q2) (PGND)
- TRICKLE CHARGE
  (LINEAR)
- (near CR3) FAST CHARGE
  (SWITCHING)
- CATHODE INCORRECTLY
  MARKED ON PCB DECAL
- (near PSWOUT) scope
- (near U1) SEL = VL SETS 4.095A MAX CHARGE RATE.
  FOR THIS SETTING, RSENSE == 45mOhm.
  ChargeCurrent () CMD SETS ACTUAL CHARGE CURRENT.
- (near U1) (PGND)
- (STATLED_K)
- (PSW_IN, LED_R+)
- (near U1) SMBus serial comm req'd
  to setup, control & monitor
  MAX1647 device
  I\N\T\, an open-drain output
- (near VBATSWEN) scope
- (near VBAT_SW) scope
- (near C20) (PGND)
- PANEL PC HIGH-SIDE PWR CONTROL
- VOLTAGE REGULATOR CIRCUITS
- (IB_PWR_RTN)
- PANEL PC POWER
  (BOOST) IN: 7.2Vnom, OUT: 12V @ 2.25A
- POWER OUT
  (PANEL PC)
- (near R54) ESD
- ACNODES PC9070-HW
  REAR PWR CONN: 9-36VDC/27W
  1: V+
  2: GND
  3: CHASSIS
- (near L1) SRF=45Mhz
- (near U4) enabled >1.2V
  disabled < 0.4V
- (near 12V) scope
- vout(actual) ~ 12.1V
- C26 REMOVED
  (formerly 180uF)
- INTERFACE BRD HIGH-SIDE PWR CONTROL
  & DIFFERENTIAL COMM
- (near U4) (PGND)
- (near MOSI) (IB_PWR_RTN)
- INTERFACE BOARD POWER
  (BUCK) IN: 7.2Vnom, OUT: 5V @ 2.7A
- (near CR7) PIC active on power
  switch activation or
  presence of charger power
- PIC MCU LDO REGULATOR
  IN: ___Vnom, OUT: 5V @ 0.1A
- TO/FROM SH. 2
  PIC MCU
- IB POWER
  + COMM
- (near 5V) scope
- SPI MASTER: IB+
  SPI SLAVE:    PB+
- (near 5VTP) pogo
- (near 5VPIC) scope
- (near R29) COMP external network
  optional for extended temp
  operational requirement
- (near 5VOK) power status
  output to PIC
- TITLE:
- Document Number:
- 1700-0003_PowerBoard_REV-A
- REV:
- TransTech Systems, Inc.
- 4/22/2022
- ____-____
- R-
- PQI380+ POWER BOARD SCHEMATIC
- D
- POWER SWITCH
  & STATUS LED
- U5
  ISL85005A
  ISL85005
- POPULATE
  ---
  R31 - FCCM
  (VISHAY CRCW040210K0FKEDC)
- Date:
- 7/10/2024 1:57:37 PM
- Sheet:
- 1

## Library data of the parts
5V 5VPIC 12V BATT+ BATT-(GND) DCIN_S IBPWREN PSWOUT THERM+ THERM- VBAT_SW VBATSWEN VCHRG = TST_POINT_PTH_042-OCT: PART_DESC: PCB feature, test point, ID 42mil, OD 72mil; GateName_1: G$1; SymbolName_1: TST_POINT_PTH_042-OCT; LibraryName: TTECH; DeviceSetName: TST_POINT_PTH_042-OCT
5VIB 5VTP 12VTP LEDBLK LEDRED U1REF U1VL = TST_POINT_PTH_20X40MIL: GateName_1: G$1; SymbolName_1: TST_POINT_PTH_042-OCT; LibraryName: TTECH; DeviceSetName: TST_POINT_PTH_20X40MIL
5VOK = TST_POINT_PTH_20X40MIL_2PIN: PART_DESC: PCB FEATURE, TEST POINT, ID 20MIL, OD 40MIL; GateName_1: G$1; SymbolName_1: TST_POINT_PTH_042-OCT-2PIN; LibraryName: TTECH; DeviceSetName: TST_POINT_PTH_20X40MIL_2PIN
5VON 12VON PICPWR = LED_0603: MANUFACTURER: DIALIGHT; MANUFACTURER_PART_NUMBER: 598-8081-107F; PART_DESC: LED GREEN CLEAR 0603 SMD; GateName_1: A; SymbolName_1: LED; LibraryName: TTECH; DeviceSetName: LED_0603; COPYRIGHT: Copyright (C) 2022 Ultra Librarian. All rights reserved.
!SPI_SS! MISO MOSI SPI_CLK = TST_POINT_PTH_042_2PIN: PART_DESC: PCB feature, test point, ID 42mil, OD 72mil; GateName_1: A; SymbolName_1: TST_POINT_PTH_042-OCT-2PIN; LibraryName: TTECH; DeviceSetName: TST_POINT_PTH_042_2PIN
C1 = CAP_CER_0603_TDK: MANUFACTURER: SAMSUNG; MANUFACTURER_PART_NUMBER: CL10C221JB8NNNC; PART_DESC: CAP CER 220PF 50V C0G/NP0 0603; GateName_1: A; SymbolName_1: CAPH; LibraryName: TTECH; DeviceSetName: CAP_CER_0603_TDK
C2 C4 = CAP_CER_0603_TDK: MANUFACTURER: MURATA; MANUFACTURER_PART_NUMBER: GRM188Z71C475KE21D; PART_DESC: CAP CER 4.7UF 16V X7R 0603; GateName_1: A; SymbolName_1: CAPH; LibraryName: TTECH; DeviceSetName: CAP_CER_0603_TDK
C3 C5 = CAP_CER_1206_SAMSUNG: MANUFACTURER_PART_NUMBER: CL31A226KAHNNNE; PART_DESC: CAP CER 22UF 25V X5R 1206; GateName_1: A; SymbolName_1: CAPH; LibraryName: TTECH; DeviceSetName: CAP_CER_1206_SAMSUNG; COPYRIGHT: Copyright (C) 2022 Ultra Librarian. All rights reserved.; MANUFACTURER: SAMSUNG
C6 = CAP_SMT_EL_CORNELL-DUB_AFK106M25B12T-FCAP_AFK106M25B12T-F_CND-L: MANUFACTURER: Cornell Dubilier; PART_DESC: CAP ALUM 10UF 20% 25V SMD; GateName_1: G$1; SymbolName_1: CAPH+; DeviceName: CAP_AFK106M25B12T-F_CND-L; LibraryName: TTECH; DeviceSetName: CAP_SMT_EL_CORNELL-DUB_AFK106M25B12T-F; +: +; COPYRIGHT: Copyright (C) 2023 Ultra Librarian. All rights reserved.; MANUFACTURER_PART_NUMBER: AFK106M25B12T-F
C7 C14 = CAP_CER_0603_TDK: MANUFACTURER: SAMSUNG; MANUFACTURER_PART_NUMBER: CL10B104KB8NNNC; PART_DESC: CAP CER 0.1UF 50V X7R 0603; GateName_1: A; SymbolName_1: CAPH; LibraryName: TTECH; DeviceSetName: CAP_CER_0603_TDK
C8 C11 C15 C16 C18 C19 C32 C39 = CAP_CER_0402_MURATA: MANUFACTURER: MURATA; MANUFACTURER_PART_NUMBER: GCM155R71C104KA55D; PART_DESC: CAP CER 0.1UF 16V X7R 0402; GateName_1: A; SymbolName_1: CAPH; LibraryName: TTECH; DeviceSetName: CAP_CER_0402_MURATA
C9 = CAP_CER_0402_MURATA: MANUFACTURER: MURATA; MANUFACTURER_PART_NUMBER: C0402C473K3REC7867; PART_DESC: CAP CER 0402 47NF 25V X7R 10%; GateName_1: A; SymbolName_1: CAPH; LibraryName: TTECH; DeviceSetName: CAP_CER_0402_MURATA
C12 = CAP_CER_0402_MURATA: MANUFACTURER: MURATA; MANUFACTURER_PART_NUMBER: C0402C223K5REC7411; PART_DESC: CAP CER 0402 22NF 50V X7R 10%; GateName_1: A; SymbolName_1: CAPH; LibraryName: TTECH; DeviceSetName: CAP_CER_0402_MURATA
C13 = CAP_CER_0603_TDK: MANUFACTURER: SAMSUNG; MANUFACTURER_PART_NUMBER: CL10B105KA8NNNC; PART_DESC: CAP CER 1UF 25V X7R 0603; GateName_1: A; SymbolName_1: CAPH; LibraryName: TTECH; DeviceSetName: CAP_CER_0603_TDK
C17 = CAP_TANT_KEMET_2917: MANUFACTURER: KEMET; MANUFACTURER_PART_NUMBER: T495D226K035ATE300; PART_DESC: CAP TANT 22UF 10% 35V 2917; GateName_1: A; SymbolName_1: PCAPH; LibraryName: TTECH; DeviceSetName: CAP_TANT_KEMET_2917; COPYRIGHT: Copyright (C) 2022 Ultra Librarian. All rights reserved.
C20 = CAP_TANTALUM_KEMET_T495D: MANUFACTURER: KEMET; MANUFACTURER_PART_NUMBER: T495D476K025ATE250; PART_DESC: CAP TANT 47UF 10% 25V 2917; GateName_1: A; SymbolName_1: PCAPH; LibraryName: TTECH; DeviceSetName: CAP_TANTALUM_KEMET_T495D; COPYRIGHT: Copyright (C) 2022 Ultra Librarian. All rights reserved.
C21 = CAP_CER_1206_SAMSUNG: MANUFACTURER_PART_NUMBER: CL31B106KBHNNNE; PART_DESC: CAP CER 10UF 50V X7R 1206; GateName_1: A; SymbolName_1: CAPH; QTY_AREA: (__X); LibraryName: TTECH; DeviceSetName: CAP_CER_1206_SAMSUNG; COPYRIGHT: Copyright (C) 2022 Ultra Librarian. All rights reserved.; MANUFACTURER: SAMSUNG
C22 = CAP_CER_0402_MURATA: MANUFACTURER: MURATA; MANUFACTURER_PART_NUMBER: GRM155R71E223KA61D; PART_DESC: Multilayer Ceramic Capacitors MLCC - SMD/SMT .022UF 25V 10% 0402; GateName_1: A; SymbolName_1: CAPH; LibraryName: TTECH; DeviceSetName: CAP_CER_0402_MURATA
C23 = CAP_CER_1206_SAMSUNG: MANUFACTURER_PART_NUMBER: GCM31CC81E226KE11L; PART_DESC: CAP CER 22UF 25V X6S 1206; GateName_1: A; SymbolName_1: CAPH; LibraryName: TTECH; DeviceSetName: CAP_CER_1206_SAMSUNG; COPYRIGHT: Copyright (C) 2022 Ultra Librarian. All rights reserved.; MANUFACTURER: SAMSUNG
C24 C25 = CAP_CER_1206_SAMSUNG: MANUFACTURER_PART_NUMBER: GCM31CC81E226KE11L; PART_DESC: CAP CER 22UF 25V X6S 1206; GateName_1: A; SymbolName_1: CAPH; QTY_AREA: (3X); LibraryName: TTECH; DeviceSetName: CAP_CER_1206_SAMSUNG; COPYRIGHT: Copyright (C) 2022 Ultra Librarian. All rights reserved.; MANUFACTURER: SAMSUNG
C27 = CAP_CER_0402_MURATA: MANUFACTURER: MURATA; PART_DESC: --- DO NOT POPULATE ---; GateName_1: A; SymbolName_1: CAPH; LibraryName: TTECH; DeviceSetName: CAP_CER_0402_MURATA; MANUFACTURER_PART_NUMBER: MANUFACTURER_PART_NUMBER
C28 = CAP_CER_0402_MURATA: MANUFACTURER: MURATA; MANUFACTURER_PART_NUMBER: GRM155R61E105KA12D; PART_DESC: CAP CER 1UF 25V X5R 0402; GateName_1: A; SymbolName_1: CAPH; LibraryName: TTECH; DeviceSetName: CAP_CER_0402_MURATA
C29 = CAP_CER_0402_MURATA: MANUFACTURER: MURATA; MANUFACTURER_PART_NUMBER: C0402C120K5RAC7867; PART_DESC: CAP CER 12PF 50V X7R 0402; GateName_1: A; SymbolName_1: CAPH; LibraryName: TTECH; DeviceSetName: CAP_CER_0402_MURATA
C30 = CAP_CER_TDK_CKG57: MANUFACTURER: TDK; MANUFACTURER_PART_NUMBER: CKG57NX7R1H476M500JH; PART_DESC: 47 µF ±20% 50V Ceramic Capacitor X7R Stacked SMD, 2 J-Lead; GateName_1: A; SymbolName_1: CAPH; QTY_AREA: (2X); LibraryName: TTECH; DeviceSetName: CAP_CER_TDK_CKG57; COPYRIGHT: Copyright (C) 2022 Ultra Librarian. All rights reserved.
C31 = CAP_CER_TDK_CKG57: MANUFACTURER: TDK; MANUFACTURER_PART_NUMBER: CKG57NX7R1H476M500JH; PART_DESC: 47 µF ±20% 50V Ceramic Capacitor X7R Stacked SMD, 2 J-Lead; GateName_1: A; SymbolName_1: CAPH; LibraryName: TTECH; DeviceSetName: CAP_CER_TDK_CKG57; COPYRIGHT: Copyright (C) 2022 Ultra Librarian. All rights reserved.
C33 = CAP_CER_1206_SAMSUNG: MANUFACTURER_PART_NUMBER: CL31A226KAHNNNE; PART_DESC: CAP CER 22UF 25V X5R 1206; GateName_1: A; SymbolName_1: CAPH; QTY_AREA: (2X); LibraryName: TTECH; DeviceSetName: CAP_CER_1206_SAMSUNG; COPYRIGHT: Copyright (C) 2022 Ultra Librarian. All rights reserved.; MANUFACTURER: SAMSUNG
C36 = CAP_CER_0402_MURATA: MANUFACTURER: MURATA; MANUFACTURER_PART_NUMBER: GRM155C81C225ME15D; PART_DESC: CAP CER 2.2UF 16V X6S 0402; GateName_1: A; SymbolName_1: CAPH; LibraryName: TTECH; DeviceSetName: CAP_CER_0402_MURATA
C43 = CAP_CER_0603_TDK: MANUFACTURER: MURATA; MANUFACTURER_PART_NUMBER: GRM188D71A106KA73D; PART_DESC: CAP CER 10UF 10V X7T 0603; GateName_1: A; SymbolName_1: CAPH; LibraryName: TTECH; DeviceSetName: CAP_CER_0603_TDK
CR1 CR4 = DIODE_SMA: MANUFACTURER: DIODES INC.; MANUFACTURER_PART_NUMBER: ES1A-13-F; PART_DESC: DIODE GEN PURP 50V 1A SMA; GateName_1: A; SymbolName_1: DIODE; LibraryName: TTECH; DeviceSetName: DIODE_SMA; COPYRIGHT: Copyright (C) 2022 Ultra Librarian. All rights reserved.
CR2 = DIODE_SCHOTTKY_SMC: MANUFACTURER: DIODES INC.; MANUFACTURER_PART_NUMBER: B560CQ-13-F; PART_DESC: DIODE SCHOTTKY 60V 5A SMC; GateName_1: A; SymbolName_1: DIODES; QTY_AREA: (2X); LibraryName: TTECH; DeviceSetName: DIODE_SCHOTTKY_SMC; COPYRIGHT: Copyright (C) 2022 Ultra Librarian. All rights reserved.
CR3 = DIODE_SCHOTTKY_SMC: PART_DESC: DIODE SCHOTTKY 60V 5A SMC; GateName_1: A; SymbolName_1: DIODES; LibraryName: TTECH; DeviceSetName: DIODE_SCHOTTKY_SMC; COPYRIGHT: Copyright (C) 2022 Ultra Librarian. All rights reserved.
CR5 = DIODE_ZENER_VISHAY_BZD27C4V3P-E3-08: MANUFACTURER: VISHAY; PART_DESC: DIODE ZENER 4.3V 800MW DO219AB; GateName_1: A; SymbolName_1: DIODE_ZENER; LibraryName: TTECH; DeviceSetName: DIODE_ZENER_VISHAY_BZD27C4V3P-E3-08; COPYRIGHT: Copyright (C) 2022 Ultra Librarian. All rights reserved.; MANUFACTURER_PART_NUMBER: BZD27C4V3P-E3-08
CR6 CR7 = DIODE_SCHOTTKY_TOSHIBA_1SS404: MANUFACTURER_PART_NUMBER: 1SS404; PART_DESC: DIODE SCHOTTKY 20V 300MA USC; GateName_1: A; SymbolName_1: DIODE_SCHOTTY; LibraryName: TTECH; DeviceSetName: DIODE_SCHOTTKY_TOSHIBA_1SS404; COPYRIGHT: Copyright (C) 2022 Ultra Librarian. All rights reserved.; MANUFACTURER: TOSHIBA
J1 = MOLEX_MINI-FIT-JR_462075004: PART_DESC: MINI-FIT JR LCP VERT. HDR PEGS 4; GateName_1: G$1; SymbolName_1: 462075004; LibraryName: TTECH; DeviceSetName: MOLEX_MINI-FIT-JR_462075004
J2 = MOLEX_NANO-FIT_1053111302: MANUFACTURER: MOLEX; PART_DESC: CONN HEADER VERT 2POS 2.5MM; GateName_1: A; SymbolName_1: CON_1053111302; LibraryName: TTECH; DeviceSetName: MOLEX_NANO-FIT_1053111302; COPYRIGHT: Copyright (C) 2022 Ultra Librarian. All rights reserved.; MANUFACTURER_PART_NUMBER: MANUFACTURER_PART_NUMBER
J3 = MOLEX_NANO-FIT_1053111304: PART_DESC: HEADER, NANOFIT, VERT, 4 POS 2.5mm; GateName_1: G$1; SymbolName_1: CON_1054301304; LibraryName: TTECH; DeviceSetName: MOLEX_NANO-FIT_1053111304; MANUFACTURER: MANUFACTURER; MANUFACTURER_PART_NUMBER: MANUFACTURER_PART_NUMBER
J4 = MOLEX_1053111206: PART_DESC: CONN HEADER VERT 6POS 2.5MM; GateName_1: A; SymbolName_1: CON_1053111206; LibraryName: TTECH; DeviceSetName: MOLEX_1053111206; COPYRIGHT: Copyright (C) 2022 Ultra Librarian. All rights reserved.; MANUFACTURER: MANUFACTURER; MANUFACTURER_PART_NUMBER: MANUFACTURER_PART_NUMBER
J5 = MOLEX_NANO-FIT_1053111303: MANUFACTURER: MOLEX; PART_DESC: CONN HEADER VERT 3POS 2.5MM; GateName_1: A; SymbolName_1: CON_1053111303; LibraryName: TTECH; DeviceSetName: MOLEX_NANO-FIT_1053111303; COPYRIGHT: Copyright (C) 2022 Ultra Librarian. All rights reserved.; MANUFACTURER_PART_NUMBER: MANUFACTURER_PART_NUMBER
J6 = CON_MOLEX_NANOFIT_1053121304: MANUFACTURER: MOLEX; PART_DESC: CONN HEADER VERT 4POS 2.5MM; GateName_1: A; SymbolName_1: CON_1053121304; LibraryName: TTECH; DeviceSetName: CON_MOLEX_NANOFIT_1053121304; 2x2: 2x2; MANUFACTURER_PART_NUMBER: MANUFACTURER_PART_NUMBER
L1 = INDUCTOR_COILCRAFT_XAL5030: MANUFACTURER_PART_NUMBER: XAL5030-122MEC; PART_DESC: Fixed Inductors 1.2uH Shld 20% 11.1A 9.4mOhms AECQ2; GateName_1: A; SymbolName_1: IND; LibraryName: TTECH; DeviceSetName: INDUCTOR_COILCRAFT_XAL5030; COPYRIGHT: Copyright (C) 2022 Ultra Librarian. All rights reserved.; MANUFACTURER: COILCRAFT
L2 = INDUCTOR_PWR_EATON_DR127-220-R: PART_DESC: FIXED IND 22UH 4A 39.1 MOHM SMD; GateName_1: A; SymbolName_1: INDUCTOR1; LibraryName: TTECH; DeviceSetName: INDUCTOR_PWR_EATON_DR127-220-R; COPYRIGHT: Copyright (C) 2022 Ultra Librarian. All rights reserved.
L3 = INDUCTOR_EATON_DRA74: MANUFACTURER: EATON; MANUFACTURER_PART_NUMBER: DRA74-3R3-R; PART_DESC: FIXED IND 3.3UH 4.16A 16MOHM SMD; GateName_1: A; SymbolName_1: IND; LibraryName: TTECH; DeviceSetName: INDUCTOR_EATON_DRA74; COPYRIGHT: Copyright (C) 2022 Ultra Librarian. All rights reserved.
Q1 Q2 = MOSFET_N-CH_DIODES-INC_DMS3015SSS-13: ENHANCEMENT MODE MOSFET; PART_DESC: N-Channel 30 V 11A (Ta) 1.55W (Ta) Surface Mount 8-SO; GateName_1: A; SymbolName_1: MOSFET_N-CH; LibraryName: TTECH; DeviceSetName: MOSFET_N-CH_DIODES-INC_DMS3015SSS-13
Q3 Q5 Q8 = MOSFET_P-CH_ALPHA&OMEGA_AO4485: Transistor: P-MOSFET; unipolar; -40V; -8A; 1.1W; SO8; PART_DESC: MOSFET P-CH 40V 10A 8SOIC; GateName_1: G$1; SymbolName_1: AO4485; LibraryName: TTECH; DeviceSetName: MOSFET_P-CH_ALPHA&OMEGA_AO4485; 4: 4
Q4 = TRANS_PNP_SOT-23-3_DIOTEC: PART_DESC: Bipolar Transistors - BJT Bipolar Transistor, SOT-23, 45V, 800mA, PNP; GateName_1: A; SymbolName_1: TRANS_PNP; LibraryName: TTECH; DeviceSetName: TRANS_PNP_SOT-23-3_DIOTEC
Q6 = MOSFET_P-CH_VISHAY_SI7145DP-T1-GE3: MANUFACTURER: VISHAY; PART_DESC: MOSFET P-CH 30V 60A PPAK SO-8; GateName_1: A; SymbolName_1: TRANS_N-MOSFET8V2_01; LibraryName: TTECH; DeviceSetName: MOSFET_P-CH_VISHAY_SI7145DP-T1-GE3; 4: 4
Q7 Q9-Q11 = MMBT2222ATT3G: MANUFACTURER: ONSEMI; PART_DESC: TRANS NPN 40V 0.6A SC75 SOT416; GateName_1: A; SymbolName_1: MMBT2222ATT3G; LibraryName: TTECH; DeviceSetName: MMBT2222ATT3G; MANUFACTURER_PART_NUMBER: MMBT2222ATT3G
R4 R8-R10 R21 R25 R27 R29 R35-R37 R58 R59 R61 R62 = RES_0402_VISHAY: RES SMD ... 0402; MANUFACTURER: VISHAY; PART_DESC: RES 10K OHM 1% 1/16W 0402; GateName_1: G$1; SymbolName_1: CRCW040210K0FKEDC; LibraryName: TTECH; DeviceSetName: RES_0402_VISHAY; MANUFACTURER_PART_NUMBER: CRCW040210K0FKEDC
R5 = RES_0402_VISHAY: RES SMD ... 0402; MANUFACTURER: STACKPOLE; MANUFACTURER_PART_NUMBER: RMCF0402FT133K; PART_DESC: RES 133K OHM 1% 1/16W 0402; GateName_1: G$1; SymbolName_1: CRCW040210K0FKEDC; LibraryName: TTECH; DeviceSetName: RES_0402_VISHAY
R6 = RES_0402_VISHAY: RES SMD ... 0402; MANUFACTURER: TECONN; MANUFACTURER_PART_NUMBER: CPF0402B86K6E1; PART_DESC: RES SMD 86.6KOHM 0.1% 1/16W 0402; GateName_1: G$1; SymbolName_1: CRCW040210K0FKEDC; LibraryName: TTECH; DeviceSetName: RES_0402_VISHAY
R11 = RES_0402_VISHAY: RES SMD ... 0402; MANUFACTURER: VISHAY; MANUFACTURER_PART_NUMBER: CRCW0402174KFKTD; PART_DESC: Thick Film Resistors - SMD 1/16watt 174Kohms 1%; GateName_1: G$1; SymbolName_1: CRCW040210K0FKEDC; LibraryName: TTECH; DeviceSetName: RES_0402_VISHAY
R12 = RES_0402_VISHAY: RES SMD ... 0402; MANUFACTURER: YAGEO; MANUFACTURER_PART_NUMBER: RC0402FR-07178KL; PART_DESC: RES 178K OHM 1% 1/16W 0402; GateName_1: G$1; SymbolName_1: CRCW040210K0FKEDC; LibraryName: TTECH; DeviceSetName: RES_0402_VISHAY
R13 = RES_0402_VISHAY: RES SMD ... 0402; MANUFACTURER: VISHAY; MANUFACTURER_PART_NUMBER: CRCW0402732KFKED; PART_DESC: Thick Film Resistors - SMD 1/16watt 732Kohms 1%; GateName_1: G$1; SymbolName_1: CRCW040210K0FKEDC; LibraryName: TTECH; DeviceSetName: RES_0402_VISHAY
R16 R20 = RES_0402_VISHAY: RES SMD ... 0402; MANUFACTURER: VISHAY; MANUFACTURER_PART_NUMBER: CRCW040210R0FKEDC; PART_DESC: RES 10 OHM 1% 1/16W 0402; GateName_1: G$1; SymbolName_1: CRCW040210K0FKEDC; LibraryName: TTECH; DeviceSetName: RES_0402_VISHAY
R17 R18 = RES_2512_TECONN: MANUFACTURER: TECONN; MANUFACTURER_PART_NUMBER: TLRP3A20CR090FTE; PART_DESC: RES 0.09 OHM 1% 2W 2512; GateName_1: A; SymbolName_1: RES; QTY_AREA: (2X); LibraryName: TTECH; DeviceSetName: RES_2512_TECONN
R19 R54 R57 = RES_0805_STACKPOLE: MANUFACTURER_PART_NUMBER: HCJ0805ZT0R00; PART_DESC: RES 0 OHM JUMPER 1/2W 0805; GateName_1: A; SymbolName_1: RES; LibraryName: TTECH; DeviceSetName: RES_0805_STACKPOLE; COPYRIGHT: Copyright (C) 2022 Ultra Librarian. All rights reserved.; MANUFACTURER: STACKPOLE
R22 = RES_0402_VISHAY: RES SMD ... 0402; MANUFACTURER: VISHAY; MANUFACTURER_PART_NUMBER: CRCW040280K6FKED; PART_DESC: RES SMD 80.6K OHM 1% 1/16W 0402; GateName_1: G$1; SymbolName_1: CRCW040210K0FKEDC; LibraryName: TTECH; DeviceSetName: RES_0402_VISHAY
R23 = RES_0402_VISHAY: RES SMD ... 0402; MANUFACTURER: VISHAY; MANUFACTURER_PART_NUMBER: MCS0402MD4993BE000; PART_DESC: MCS 0402-25 0.1% AT E0 499K; GateName_1: G$1; SymbolName_1: CRCW040210K0FKEDC; LibraryName: TTECH; DeviceSetName: RES_0402_VISHAY
R24 = RES_0402_VISHAY: RES SMD ... 0402; MANUFACTURER: VISHAY; MANUFACTURER_PART_NUMBER: TNPW040295K3BEED; PART_DESC: RES 95.3K OHM 0.1% 1/16W 0402; GateName_1: G$1; SymbolName_1: CRCW040210K0FKEDC; LibraryName: TTECH; DeviceSetName: RES_0402_VISHAY
R26 R56 = RES_0603_STACKPOLE: MANUFACTURER_PART_NUMBER: RMCF0603FT1K15; PART_DESC: RES 1.15K OHM 1% 1/10W 0603; GateName_1: A; SymbolName_1: RES; LibraryName: TTECH; DeviceSetName: RES_0603_STACKPOLE; COPYRIGHT: Copyright (C) 2022 Ultra Librarian. All rights reserved.; MANUFACTURER: STACKPOLE
R28 R38 R60 R63 = RES_0402_VISHAY: RES SMD ... 0402; MANUFACTURER: VISHAY; MANUFACTURER_PART_NUMBER: CRCW04021K00FKEDC; PART_DESC: RES 1K OHM 1% 1/16W 0402; GateName_1: G$1; SymbolName_1: CRCW040210K0FKEDC; LibraryName: TTECH; DeviceSetName: RES_0402_VISHAY
R30 = RES_0603_STACKPOLE: MANUFACTURER_PART_NUMBER: RNCS0603BKE10K0; PART_DESC: RES 10K OHM 0.1% 1/16W 0603; GateName_1: A; SymbolName_1: RES; LibraryName: TTECH; DeviceSetName: RES_0603_STACKPOLE; COPYRIGHT: Copyright (C) 2022 Ultra Librarian. All rights reserved.; MANUFACTURER: STACKPOLE
R31 = RES_0402_VISHAY: RES SMD ... 0402; MANUFACTURER: ---; PART_DESC: DNP - RES 0402; GateName_1: G$1; SymbolName_1: CRCW040210K0FKEDC; LibraryName: TTECH; DeviceSetName: RES_0402_VISHAY; MANUFACTURER_PART_NUMBER: ---
R55 = RES_1206_YAGEO: MANUFACTURER: VISHAY; MANUFACTURER_PART_NUMBER: CRCW12064K64FKEAC; PART_DESC: RES 4.64K OHM 1% 1/4W 1206; GateName_1: A; SymbolName_1: RES; LibraryName: TTECH; DeviceSetName: RES_1206_YAGEO; COPYRIGHT: Copyright (C) 2022 Ultra Librarian. All rights reserved.
U1 = MAX1647EAP+: PART_DESC: IC BATT CHG MULTI-CHEM 20SSOP; GateName_1: A; SymbolName_1: MAX1647EAP+; LibraryName: TTECH; DeviceSetName: MAX1647EAP+; MANUFACTURER_PART_NUMBER: MAX1647EAP+
U3 = AD_REFERENCE_ADR364AUJZ-REEL7: PART_DESC: Series Voltage Reference IC Fixed 4.096V V ±0.2% 5 mA TSOT-23-5; GateName_1: A; SymbolName_1: ADR364AUJZ-REEL7; LibraryName: TTECH; DeviceSetName: AD_REFERENCE_ADR364AUJZ-REEL7
U4 = REGULATOR_BOOST_TI_TPS61178RNWT: PART_DESC: IC REG BOOST ADJ 10A 13VQFN; GateName_1: A; SymbolName_1: TPS611781RNW; LibraryName: TTECH; DeviceSetName: REGULATOR_BOOST_TI_TPS61178RNWT; COPYRIGHT: Copyright (C) 2022 Ultra Librarian. All rights reserved.
U5 = REGULATOR_BUCK_RENESAS_ISL85005AFRZ-T7A: RENESAS - ISL85005AFRZ-T7A - DC/DC CONV, SYNC BUCK, DFN-12   Source:  Datasheet   Check availability; PART_DESC: Buck Switching Regulator IC Positive Adjustable 5V 1 Output 5A 12-VFDFN Exposed Pad; GateName_1: G$1; SymbolName_1: ISL85005AFRZ-T7A; LibraryName: TTECH; DeviceSetName: REGULATOR_BUCK_RENESAS_ISL85005AFRZ-T7A
U6 = IC_LDO_STM_LD2981CM50TR: PART_DESC: Linear Voltage Regulator IC Positive Fixed 1 Output 100mA SOT-23-5; GateName_1: A; SymbolName_1: LD2981CM50TR; LibraryName: TTECH; DeviceSetName: IC_LDO_STM_LD2981CM50TR; COPYRIGHT: Copyright (C) 2022 Ultra Librarian. All rights reserved.
U7 = IC_H-BRIDGE_TI_DRV8220DRLR: PART_DESC: 20-V, 1-A H-BRIDGE MOTOR DRIVER; GateName_1: A; SymbolName_1: DRV8220DRL; LibraryName: TTECH; DeviceSetName: IC_H-BRIDGE_TI_DRV8220DRLR